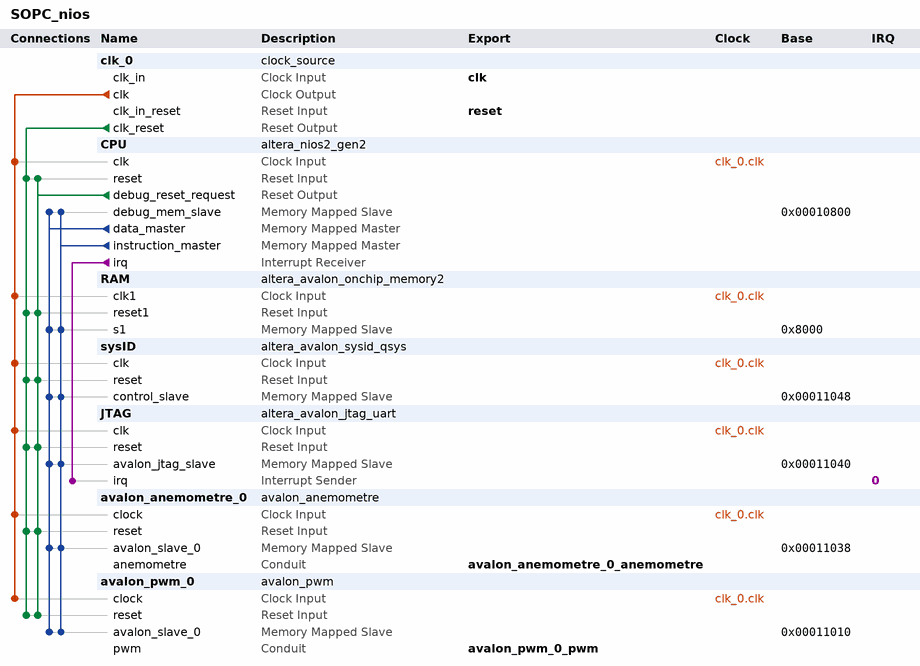
[diagram p0: system contents]
# Platform Designer (Qsys) system SOPC_nios, Cyclone IV E EP4CE22F17C6
# Parameters at their usual value, and those the tool derives, are not listed.
package require -exact qsys 18.1
create_system SOPC_nios
set_project_property DEVICE_FAMILY {Cyclone IV E}
set_project_property DEVICE EP4CE22F17C6

add_instance clk_0 clock_source 18.1
set_instance_parameter_value clk_0 clockFrequency 50000000

add_instance CPU altera_nios2_gen2 18.1
set_instance_parameter_value CPU dcache_size 2048
set_instance_parameter_value CPU exceptionSlave RAM.s1
set_instance_parameter_value CPU icache_size 4096
set_instance_parameter_value CPU impl Tiny
set_instance_parameter_value CPU resetSlave RAM.s1

add_instance RAM altera_avalon_onchip_memory2 18.1
set_instance_parameter_value RAM dataWidth 32
set_instance_parameter_value RAM dualPort false
set_instance_parameter_value RAM initMemContent true
set_instance_parameter_value RAM initializationFileName onchip_mem.hex
set_instance_parameter_value RAM memorySize 32768

add_instance sysID altera_avalon_sysid_qsys 18.1
set_instance_parameter_value sysID id 0

add_instance JTAG altera_avalon_jtag_uart 18.1
set_instance_parameter_value JTAG simInteractiveOptions NO_INTERACTIVE_WINDOWS

add_instance avalon_anemometre_0 avalon_anemometre 1.0
set_instance_parameter_value avalon_anemometre_0 max_1s 50000000
set_instance_parameter_value avalon_anemometre_0 max_debounce 50000

add_instance avalon_pwm_0 avalon_pwm 1.0

# connections
add_connection clk_0.clk avalon_anemometre_0.clock clock
add_connection clk_0.clk avalon_pwm_0.clock clock
add_connection clk_0.clk CPU.clk clock
add_connection clk_0.clk JTAG.clk clock
add_connection clk_0.clk RAM.clk1 clock
add_connection clk_0.clk sysID.clk clock
add_connection clk_0.clk_reset avalon_anemometre_0.reset reset
add_connection clk_0.clk_reset avalon_pwm_0.reset reset
add_connection clk_0.clk_reset CPU.reset reset
add_connection clk_0.clk_reset JTAG.reset reset
add_connection clk_0.clk_reset RAM.reset1 reset
add_connection clk_0.clk_reset sysID.reset reset
add_connection CPU.debug_reset_request avalon_anemometre_0.reset reset
add_connection CPU.debug_reset_request avalon_pwm_0.reset reset
add_connection CPU.debug_reset_request CPU.reset reset
add_connection CPU.debug_reset_request JTAG.reset reset
add_connection CPU.debug_reset_request RAM.reset1 reset
add_connection CPU.debug_reset_request sysID.reset reset
add_connection CPU.data_master avalon_anemometre_0.avalon_slave_0 avalon
set_connection_parameter_value CPU.data_master/avalon_anemometre_0.avalon_slave_0 baseAddress 0x00011038
add_connection CPU.data_master avalon_pwm_0.avalon_slave_0 avalon
set_connection_parameter_value CPU.data_master/avalon_pwm_0.avalon_slave_0 baseAddress 0x00011010
add_connection CPU.data_master CPU.debug_mem_slave avalon
set_connection_parameter_value CPU.data_master/CPU.debug_mem_slave baseAddress 0x00010800
add_connection CPU.data_master JTAG.avalon_jtag_slave avalon
set_connection_parameter_value CPU.data_master/JTAG.avalon_jtag_slave baseAddress 0x00011040
add_connection CPU.data_master RAM.s1 avalon
set_connection_parameter_value CPU.data_master/RAM.s1 baseAddress 0x8000
add_connection CPU.data_master sysID.control_slave avalon
set_connection_parameter_value CPU.data_master/sysID.control_slave baseAddress 0x00011048
add_connection CPU.instruction_master avalon_anemometre_0.avalon_slave_0 avalon
set_connection_parameter_value CPU.instruction_master/avalon_anemometre_0.avalon_slave_0 baseAddress 0x00011038
add_connection CPU.instruction_master avalon_pwm_0.avalon_slave_0 avalon
set_connection_parameter_value CPU.instruction_master/avalon_pwm_0.avalon_slave_0 baseAddress 0x00011010
add_connection CPU.instruction_master CPU.debug_mem_slave avalon
set_connection_parameter_value CPU.instruction_master/CPU.debug_mem_slave baseAddress 0x00010800
add_connection CPU.instruction_master JTAG.avalon_jtag_slave avalon
set_connection_parameter_value CPU.instruction_master/JTAG.avalon_jtag_slave baseAddress 0x00011040
add_connection CPU.instruction_master RAM.s1 avalon
set_connection_parameter_value CPU.instruction_master/RAM.s1 baseAddress 0x8000
add_connection CPU.instruction_master sysID.control_slave avalon
set_connection_parameter_value CPU.instruction_master/sysID.control_slave baseAddress 0x00011048
add_connection CPU.irq JTAG.irq interrupt
set_connection_parameter_value CPU.irq/JTAG.irq irqNumber 0

# exported interfaces
add_interface avalon_anemometre_0_anemometre conduit end
set_interface_property avalon_anemometre_0_anemometre EXPORT_OF avalon_anemometre_0.anemometre
add_interface avalon_pwm_0_pwm conduit end
set_interface_property avalon_pwm_0_pwm EXPORT_OF avalon_pwm_0.pwm
add_interface clk clock sink
set_interface_property clk EXPORT_OF clk_0.clk_in
add_interface reset reset sink
set_interface_property reset EXPORT_OF clk_0.clk_in_reset

set_interconnect_requirement {$system} qsys_mm.clockCrossingAdapter HANDSHAKE
set_interconnect_requirement {$system} qsys_mm.enableEccProtection FALSE
set_interconnect_requirement {$system} qsys_mm.insertDefaultSlave FALSE
set_interconnect_requirement {$system} qsys_mm.maxAdditionalLatency 1

save_system SOPC_nios.qsys
